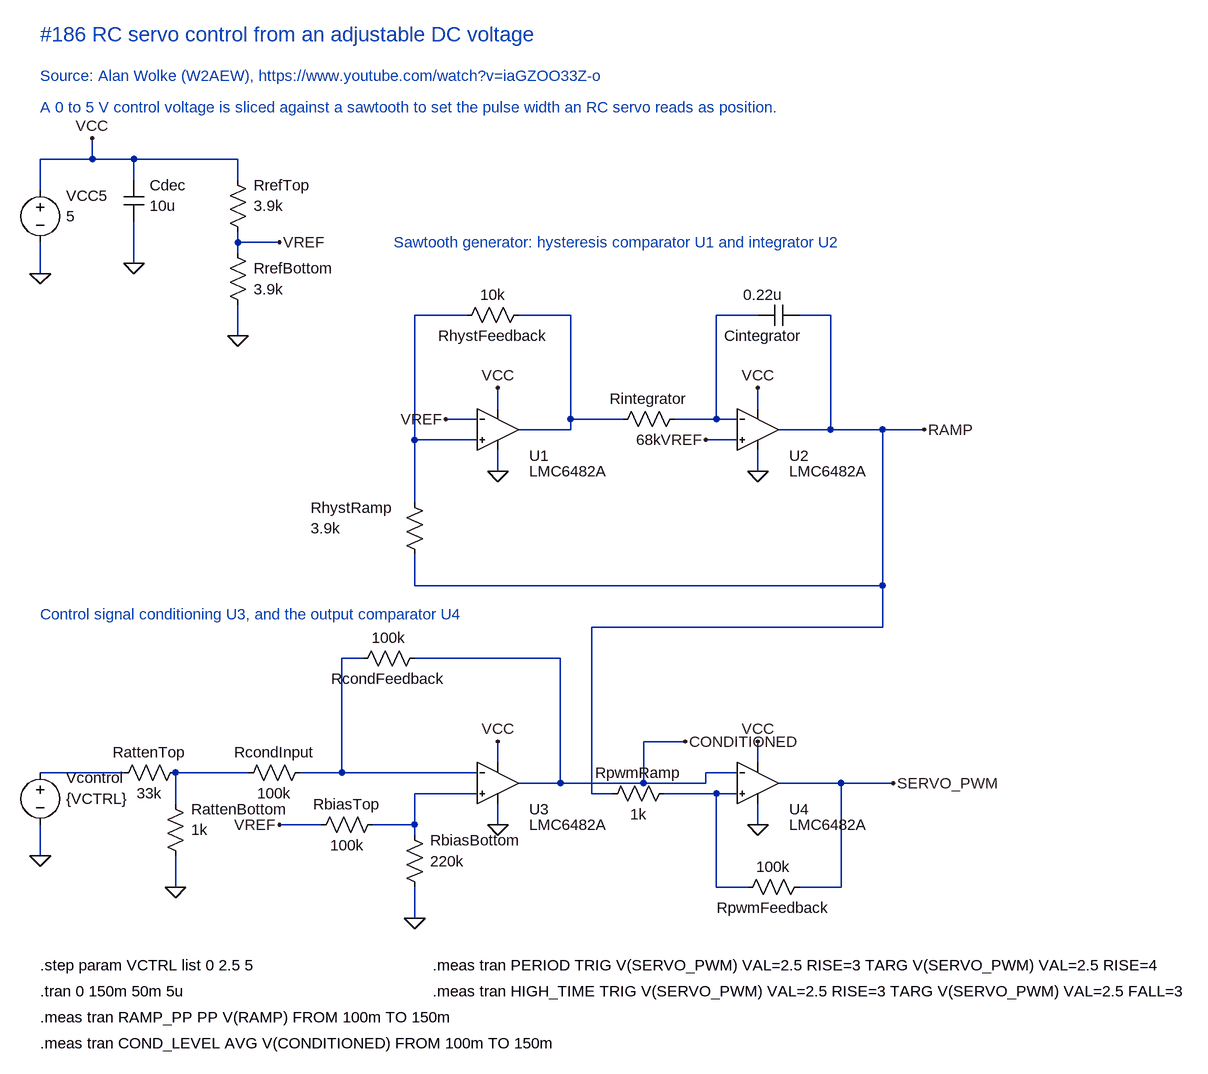
[diagram p0: schematic Analog voltage servo controller.asc]
Analog voltage servo controller.asc, the LTspice schematic file:
Version 4.1
SHEET 1 1600 1700
WIRE 96 288 96 240
WIRE 240 240 96 240
WIRE 240 272 240 240
WIRE 176 208 176 240
WIRE 400 240 240 240
WIRE 400 272 400 240
WIRE 400 384 400 352
WIRE 464 368 400 368
WIRE 96 416 96 368
WIRE 240 400 240 336
WIRE 400 512 400 464
WIRE 672 480 672 768
WIRE 752 480 672 480
WIRE 832 480 912 480
WIRE 912 480 912 656
WIRE 768 672 672 672
WIRE 768 640 720 640
WIRE 800 624 800 592
WIRE 800 688 800 720
WIRE 832 656 912 656
WIRE 912 640 992 640
WIRE 1072 640 1168 640
WIRE 1168 672 1120 672
WIRE 1200 624 1200 592
WIRE 1200 688 1200 720
WIRE 1232 656 1312 656
WIRE 1200 480 1136 480
WIRE 1136 480 1136 640
WIRE 1264 480 1312 480
WIRE 1312 480 1312 656
WIRE 1312 656 1392 656
WIRE 1392 656 1456 656
WIRE 672 848 672 896
WIRE 672 896 1392 896
WIRE 1392 896 1392 656
WIRE 1392 896 1392 960
WIRE 1392 960 944 960
WIRE 944 960 944 1216
WIRE 96 1184 192 1184
WIRE 192 1184 224 1184
WIRE 304 1184 384 1184
WIRE 304 1184 304 1232
WIRE 304 1360 304 1312
WIRE 96 1312 96 1264
WIRE 384 1184 416 1184
WIRE 496 1184 768 1184
WIRE 592 1008 560 1008
WIRE 560 1008 560 1184
WIRE 672 1008 896 1008
WIRE 896 1008 896 1200
WIRE 832 1200 896 1200
WIRE 800 1168 800 1136
WIRE 800 1232 800 1264
WIRE 768 1216 672 1216
WIRE 672 1216 672 1264
WIRE 672 1264 672 1280
WIRE 672 1408 672 1360
WIRE 608 1264 672 1264
WIRE 528 1264 464 1264
WIRE 896 1200 1120 1200
WIRE 1120 1200 1120 1184
WIRE 1120 1184 1168 1184
WIRE 1024 1200 1024 1136
WIRE 1024 1136 1088 1136
WIRE 944 1216 976 1216
WIRE 1056 1216 1168 1216
WIRE 1200 1168 1200 1136
WIRE 1200 1232 1200 1264
WIRE 1184 1360 1136 1360
WIRE 1136 1360 1136 1216
WIRE 1264 1360 1328 1360
WIRE 1328 1360 1328 1200
WIRE 1232 1200 1328 1200
WIRE 1328 1200 1408 1200
FLAG 176 208 VCC
FLAG 96 416 0
FLAG 240 400 0
FLAG 400 512 0
FLAG 464 368 VREF
FLAG 720 640 VREF
FLAG 800 592 VCC
FLAG 800 720 0
FLAG 1120 672 VREF
FLAG 1200 592 VCC
FLAG 1200 720 0
FLAG 1456 656 RAMP
FLAG 96 1312 0
FLAG 304 1360 0
FLAG 464 1264 VREF
FLAG 800 1136 VCC
FLAG 800 1264 0
FLAG 672 1408 0
FLAG 1088 1136 CONDITIONED
FLAG 1200 1136 VCC
FLAG 1200 1264 0
FLAG 1408 1200 SERVO_PWM
SYMBOL voltage 96 272 R0
WINDOW 0 40 24 Left 2
WINDOW 3 40 56 Left 2
SYMATTR InstName VCC5
SYMATTR Value 5
SYMBOL cap 224 272 R0
WINDOW 0 40 8 Left 2
WINDOW 3 40 40 Left 2
SYMATTR InstName Cdec
SYMATTR Value 10u
SYMBOL res 384 256 R0
WINDOW 0 40 24 Left 2
WINDOW 3 40 56 Left 2
SYMATTR InstName RrefTop
SYMATTR Value 3.9k
SYMBOL res 384 368 R0
WINDOW 0 40 40 Left 2
WINDOW 3 40 72 Left 2
SYMATTR InstName RrefBottom
SYMATTR Value 3.9k
SYMBOL ..\..\LTspice\Symbols\LMC6482A-servo 800 656 R0
SYMATTR InstName U1
SYMBOL res 848 464 R90
WINDOW 0 32 56 VTop 2
WINDOW 3 0 56 VBottom 2
SYMATTR InstName RhystFeedback
SYMATTR Value 10k
SYMBOL res 656 752 R0
WINDOW 0 -144 24 Left 2
WINDOW 3 -144 56 Left 2
SYMATTR InstName RhystRamp
SYMATTR Value 3.9k
SYMBOL res 976 656 R270
WINDOW 0 32 56 VTop 2
WINDOW 3 0 56 VBottom 2
SYMATTR InstName Rintegrator
SYMATTR Value 68k
SYMBOL ..\..\LTspice\Symbols\LMC6482A-servo 1200 656 R0
SYMATTR InstName U2
SYMBOL cap 1264 464 R90
WINDOW 0 32 56 VTop 2
WINDOW 3 0 56 VBottom 2
SYMATTR InstName Cintegrator
SYMATTR Value 0.22u
SYMBOL voltage 96 1168 R0
WINDOW 0 40 24 Left 2
WINDOW 3 40 56 Left 2
SYMATTR InstName Vcontrol
SYMATTR Value {VCTRL}
SYMBOL res 208 1200 R270
WINDOW 0 32 56 VTop 2
WINDOW 3 0 56 VBottom 2
SYMATTR InstName RattenTop
SYMATTR Value 33k
SYMBOL res 288 1216 R0
WINDOW 0 40 24 Left 2
WINDOW 3 40 56 Left 2
SYMATTR InstName RattenBottom
SYMATTR Value 1k
SYMBOL res 400 1200 R270
WINDOW 0 32 56 VTop 2
WINDOW 3 0 56 VBottom 2
SYMATTR InstName RcondInput
SYMATTR Value 100k
SYMBOL res 688 992 R90
WINDOW 0 32 56 VTop 2
WINDOW 3 0 56 VBottom 2
SYMATTR InstName RcondFeedback
SYMATTR Value 100k
SYMBOL ..\..\LTspice\Symbols\LMC6482A-servo 800 1200 R0
SYMATTR InstName U3
SYMBOL res 512 1280 R270
WINDOW 0 32 56 VTop 2
WINDOW 3 0 56 VBottom 2
SYMATTR InstName RbiasTop
SYMATTR Value 100k
SYMBOL res 656 1264 R0
WINDOW 0 40 24 Left 2
WINDOW 3 40 56 Left 2
SYMATTR InstName RbiasBottom
SYMATTR Value 220k
SYMBOL res 960 1232 R270
WINDOW 0 32 56 VTop 2
WINDOW 3 0 56 VBottom 2
SYMATTR InstName RpwmRamp
SYMATTR Value 1k
SYMBOL ..\..\LTspice\Symbols\LMC6482A-servo 1200 1200 R0
SYMATTR InstName U4
SYMBOL res 1280 1344 R90
WINDOW 0 32 56 VTop 2
WINDOW 3 0 56 VBottom 2
SYMATTR InstName RpwmFeedback
SYMATTR Value 100k
TEXT 96 48 Left 3 ;#186 RC servo control from an adjustable DC voltage
TEXT 96 112 Left 2 ;Source: Alan Wolke (W2AEW), https://www.youtube.com/watch?v=iaGZOO33Z-o
TEXT 96 160 Left 2 ;A 0 to 5 V control voltage is sliced against a sawtooth to set the pulse width an RC servo reads as position.
TEXT 640 368 Left 2 ;Sawtooth generator: hysteresis comparator U1 and integrator U2
TEXT 96 940 Left 2 ;Control signal conditioning U3, and the output comparator U4
TEXT 96 1480 Left 2 !.step param VCTRL list 0 2.5 5
TEXT 96 1520 Left 2 !.tran 0 150m 50m 5u
TEXT 96 1560 Left 2 !.meas tran RAMP_PP PP V(RAMP) FROM 100m TO 150m
TEXT 700 1480 Left 2 !.meas tran PERIOD TRIG V(SERVO_PWM) VAL=2.5 RISE=3 TARG V(SERVO_PWM) VAL=2.5 RISE=4
TEXT 96 1600 Left 2 !.meas tran COND_LEVEL AVG V(CONDITIONED) FROM 100m TO 150m
TEXT 700 1520 Left 2 !.meas tran HIGH_TIME TRIG V(SERVO_PWM) VAL=2.5 RISE=3 TARG V(SERVO_PWM) VAL=2.5 FALL=3

The netlist it stands for:
* Analog voltage servo controller.asc
VCC5 VCC 0 5
Cdec VCC 0 10u
RrefTop VCC VREF 3.9k
RrefBottom VREF 0 3.9k
X§U1 N001 VREF VCC 0 N002 LMC6482A  ; pins IN+ IN- VCC VEE OUT
RhystFeedback N002 N001 10k
RhystRamp N001 RAMP 3.9k
Rintegrator N002 N003 68k
X§U2 VREF N003 VCC 0 RAMP LMC6482A  ; pins IN+ IN- VCC VEE OUT
Cintegrator RAMP N003 0.22u
Vcontrol N004 0 {VCTRL}
RattenTop N004 N005 33k
RattenBottom N005 0 1k
RcondInput N005 N006 100k
RcondFeedback CONDITIONED N006 100k
X§U3 N007 N006 VCC 0 CONDITIONED LMC6482A  ; pins IN+ IN- VCC VEE OUT
RbiasTop VREF N007 100k
RbiasBottom N007 0 220k
RpwmRamp RAMP N008 1k
X§U4 N008 CONDITIONED VCC 0 SERVO_PWM LMC6482A  ; pins IN+ IN- VCC VEE OUT
RpwmFeedback SERVO_PWM N008 100k
* #186 RC servo control from an adjustable DC voltage
* Source: Alan Wolke (W2AEW), https://www.youtube.com/watch?v=iaGZOO33Z-o
* A 0 to 5 V control voltage is sliced against a sawtooth to set the pulse width an RC servo reads as position.
* Sawtooth generator: hysteresis comparator U1 and integrator U2
* Control signal conditioning U3, and the output comparator U4
.step param VCTRL list 0 2.5 5
.tran 0 150m 50m 5u
.meas tran RAMP_PP PP V(RAMP) FROM 100m TO 150m
.meas tran PERIOD TRIG V(SERVO_PWM) VAL=2.5 RISE=3 TARG V(SERVO_PWM) VAL=2.5 RISE=4
.meas tran COND_LEVEL AVG V(CONDITIONED) FROM 100m TO 150m
.meas tran HIGH_TIME TRIG V(SERVO_PWM) VAL=2.5 RISE=3 TARG V(SERVO_PWM) VAL=2.5 FALL=3
.lib ..\..\LTspice\Models\National Semiconductor\LMC6482A.lib
.backanno
.end